# Altium project ISC-nRF52840-A-MODULE.PrjPcb
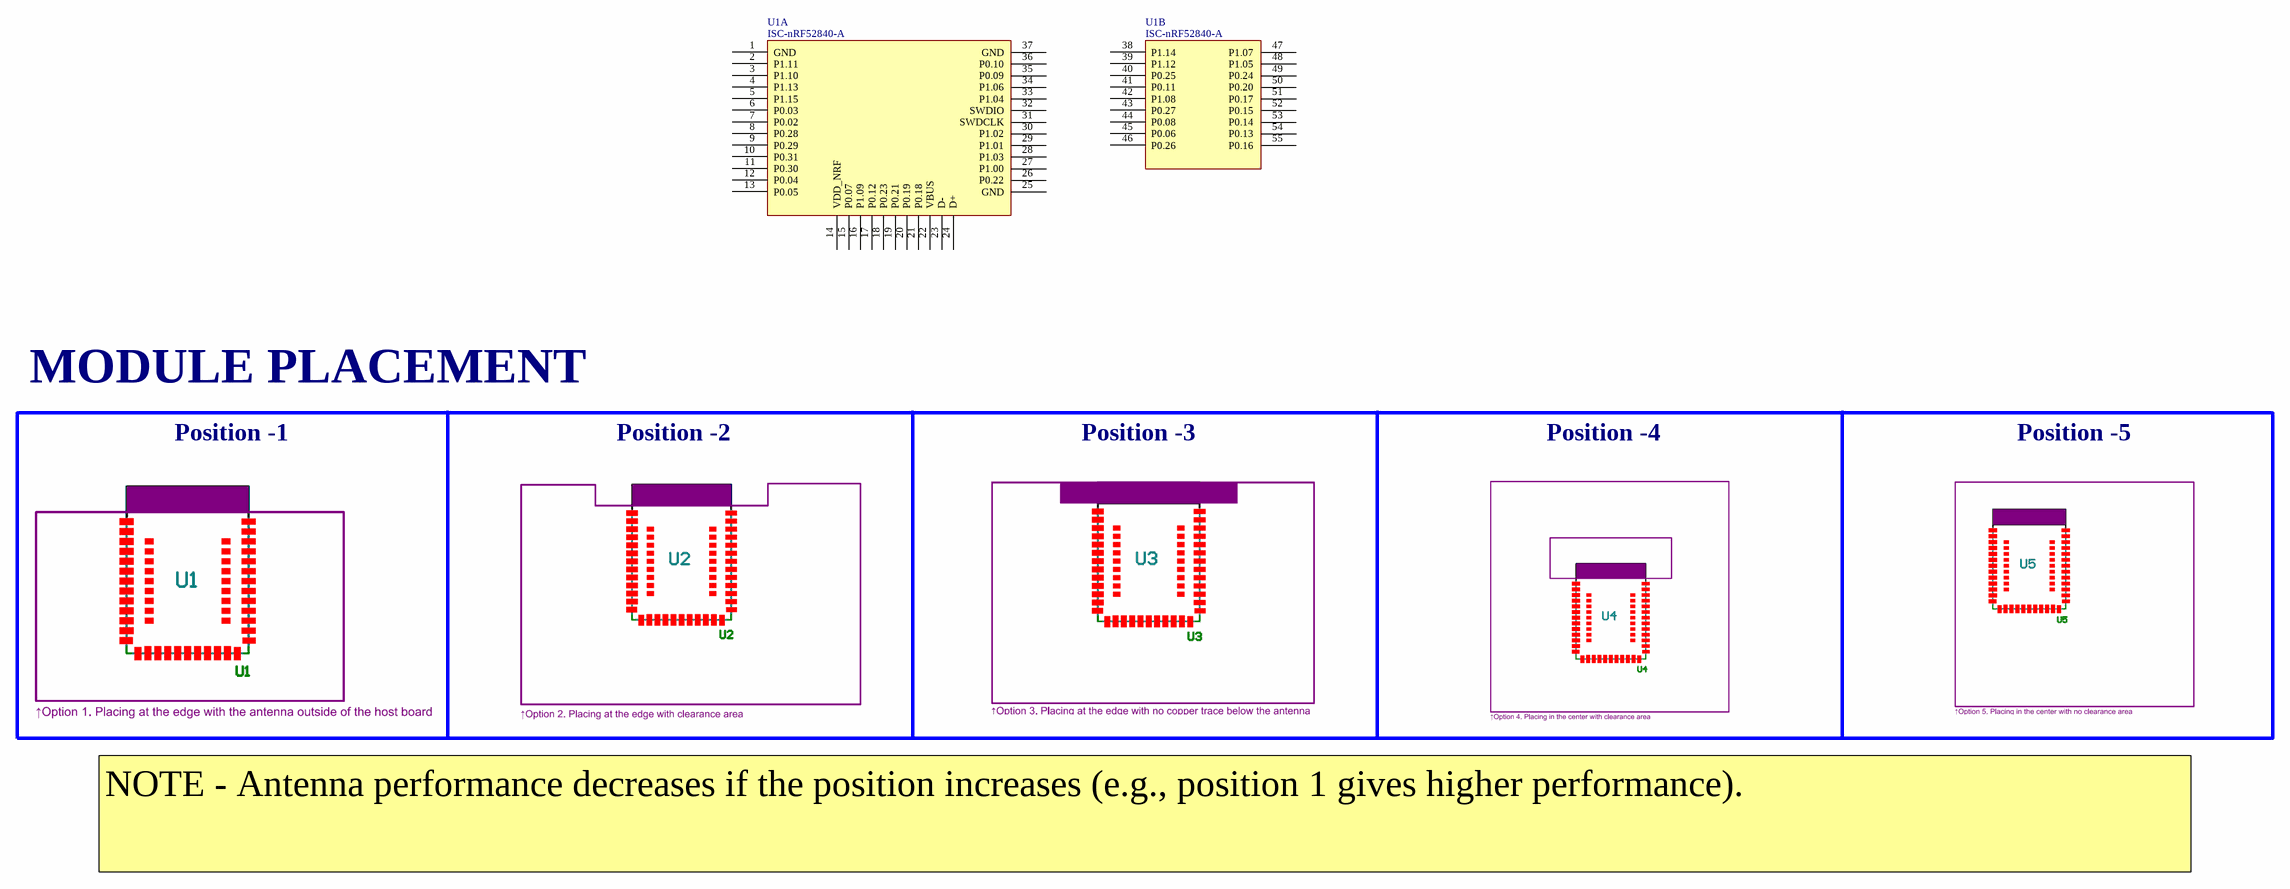
[diagram p0: ISC-nRF52840-A-MODULE.SchDoc]
1 sheet, 1 parts. Net scope: global (net labels, ports and power ports of the same name join across sheets).
Board files: ISC-nRF52840-A-MODULE-Position-1.PcbDoc, ISC-nRF52840-A-MODULE-Position-2.PcbDoc, ISC-nRF52840-A-MODULE-Position-3.PcbDoc, ISC-nRF52840-A-MODULE-Position-4.PcbDoc, ISC-nRF52840-A-MODULE-Position-5.PcbDoc

## Sheet ISC-nRF52840-A-MODULE.SchDoc: ISC-nRF52840-A-MODULE
size C; Date: 16/10/2024; CompanyName: Indiesemic; Revision: 0.1; SheetNumber: 1; SheetTotal: 1; ProjectTitle: ISC-nRF52840-A-MODULE; DesignDate: 16/10/2024

### Parts
U1  ISC-nRF52840-A  [ISC-nRF52840-MODULE]  (parts A,B of 2)

### Nets

Not connected (* = marked no-connect by the designer): U1 1(GND) 2(P1.11) 3(P1.10) 4(P1.13) 5(P1.15) 6(P0.03) 7(P0.02) 8(P0.28) 9(P0.29) 10(P0.31) 11(P0.30) 12(P0.04) 13(P0.05) 14(VDD_NRF) 15(P0.07) 16(P1.09) 17(P0.12) 18(P0.23) 19(P0.21) 20(P0.19) 21(P0.18) 22(VBUS) 23(D-) 24(D+) 25(GND) 26(P0.22) 27(P1.00) 28(P1.03) 29(P1.01) 30(P1.02) 31(SWDCLK) 32(SWDIO) 33(P1.04) 34(P1.06) 35(P0.09) 36(P0.10) 37(GND) 38(P1.14) 39(P1.12) 40(P0.25) 41(P0.11) 42(P1.08) 43(P0.27) 44(P0.08) 45(P0.06) 46(P0.26) 47(P1.07) 48(P1.05) 49(P0.24) 50(P0.20) 51(P0.17) 52(P0.15) 53(P0.14) 54(P0.13) 55(P0.16)

### Notes on the sheet
- MODULE PLACEMENT
- Position -1
- Position -2
- Position -3
- Position -4
- Position -5
- NOTE - Antenna performance decreases if the position increases (e.g., position 1 gives higher performance).
- Title:
- Document number:
- Date:
- KEY
- Revision:
- Drawn By:
- Drawn date
- Sheet:
- Approved by:
- Approved Date:
- Sheet size:
- C
- General information
- Design consideration
- Layout consideration
- THE INFORMATION CONTAINED IN THIS DESIGN IS
- CONFIDENTIAL AND PROPRIETORY
- ANY REPRODUCTION IN PART OR AS A WHOLE IS PROHIBITED
- WITHOUT THE WRITTEN PERMISSION OF THE PROPRIETOR

### Library data of the parts
U1 = ISC-nRF52840-A-MODULE